# EAGLE design Arduino LocoNet Marklin i2c Expansion (EAGLE 9.6.2)
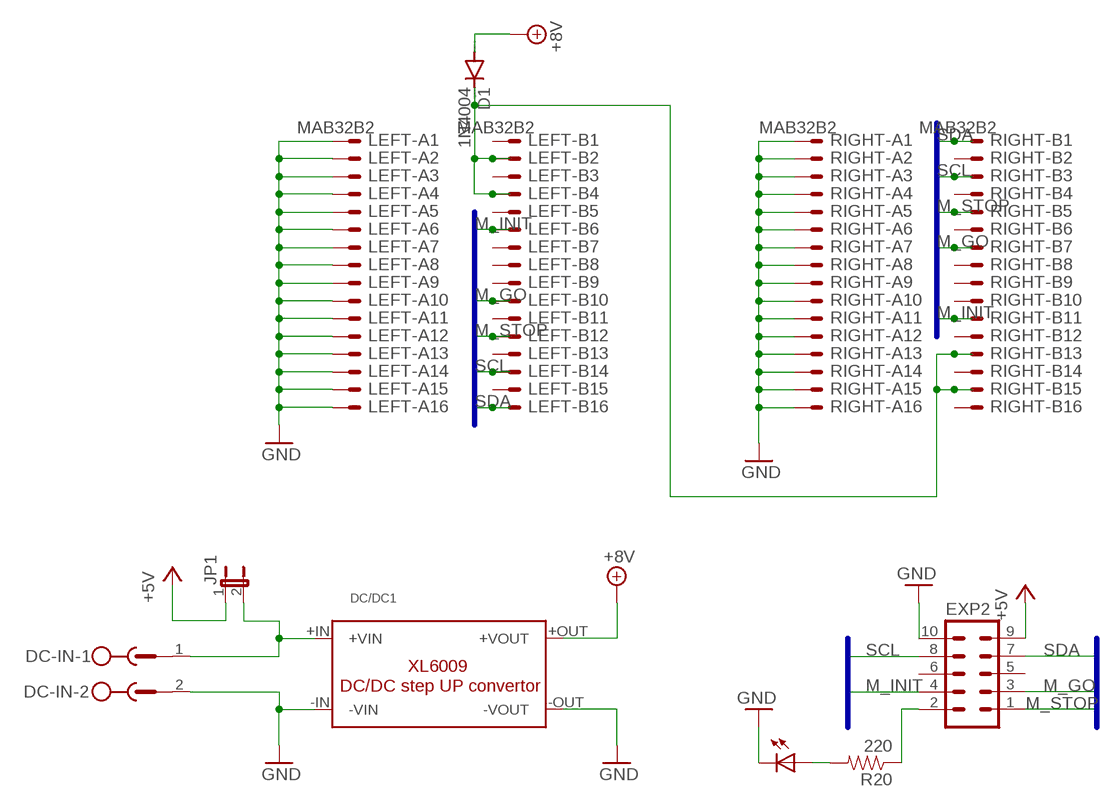
[diagram p0: schematic, sheet 1]

## Parts
D1  1N4004  [DO41-10]
DC-IN  2EDG-02  [2EDG-02]
DC/DC1  DC/DC-STEP-UP-XL6009  [DC/DC-STEP-UP-XL6009]
EXP2  ML10  [ML10]
JP1  JP1E  [JP1]
LED  RED  LED3MM  [LED3MM]
LEFT  MAB32B2  [MAB32B2]
R20  220  RESISTORAXIAL-0.3  [AXIAL-0.3]
RIGHT  MAB32B2  [MAB32B2]

## Nets
+5V [5v]: EXP2.9 JP1.1
+8V [8v]: D1.A DC/DC1.+OUT(+VOUT)
DC+ [5v]: DC-IN.1 DC/DC1.+IN(+VIN) JP1.2
GND [ground]: DC-IN.2 DC/DC1.-IN(-VIN) DC/DC1.-OUT(-VOUT) EXP2.10 LED.K(C) LEFT.A1 LEFT.A2 LEFT.A3 LEFT.A4 LEFT.A5 LEFT.A6 LEFT.A7 LEFT.A8 LEFT.A9 LEFT.A10 LEFT.A11 LEFT.A12 LEFT.A13 LEFT.A14 LEFT.A15 LEFT.A16 RIGHT.A1 RIGHT.A2 RIGHT.A3 RIGHT.A4 RIGHT.A5 RIGHT.A6 RIGHT.A7 RIGHT.A8 RIGHT.A9 RIGHT.A10 RIGHT.A11 RIGHT.A12 RIGHT.A13 RIGHT.A14 RIGHT.A15 RIGHT.A16
M_GO [Marklin]: EXP2.3 LEFT.B10 RIGHT.B7
M_INIT [Marklin]: EXP2.4 LEFT.B6 RIGHT.B11
M_STOP [Marklin]: EXP2.1 LEFT.B12 RIGHT.B5
N$3: LED.A R20.P$2
N$5 [8v]: D1.C LEFT.B2 LEFT.B4 RIGHT.B13 RIGHT.B15
PIN13: EXP2.2 R20.P$1
SCL: EXP2.8 LEFT.B14 RIGHT.B3
SDA: EXP2.7 LEFT.B16 RIGHT.B1
Unconnected: EXP2.5 EXP2.6 LEFT.B1 LEFT.B3 LEFT.B5 LEFT.B7 LEFT.B8 LEFT.B9 LEFT.B11 LEFT.B13 LEFT.B15 RIGHT.B2 RIGHT.B4 RIGHT.B6 RIGHT.B8 RIGHT.B9 RIGHT.B10 RIGHT.B12 RIGHT.B14 RIGHT.B16

## Buses
MARKLIN:M_GO,M_INIT,M_STOP,SCL,SDA

## Library data of the parts
D1 = diode:1N4004: DIODE general purpose rectifier, 1 A
DC-IN = 2EDG Connectors 5.08mm - Full Silkscreen on PCB v1-0:2EDG-02: 2EDG Connectors Rembrandt Electronics
DC/DC1 = hacesoft:DC/DC-STEP-UP-XL6009
EXP2 = con-ml:ML10: HARTING; OC_FARNELL: unknown; OC_NEWARK: unknown
JP1 = jumper:JP1E: JUMPER
LED = led:LED: LED OSRAM: - CHIPLED LG R971, LG N971, LY N971, LG Q971, LY Q971, LO R971, LY R971 LH N974, LH R974 LS Q976, LO Q976, LY Q976 LO Q996 - Hyper CHIPLED LW Q18S LB Q993, LB Q99A, LB R99A - SideLED LS A670, LO A670, LY A670, LG A670, LP A670 LB A673, LV A673, LT A673, LW A673 LH A674 LY A675 LS A676, LA A676, LO A676, LY A676, LW A676 LS A679, LY A679, LG A679 - Hyper Micro SIDELED® LS Y876, LA Y876, LO Y876, LY Y876 LT Y87S - SmartLED LW L88C, LW L88S LB L89C, LB L89S, LG L890 LS L89K, LO L89K, LY L89K LS L896, LA L896, LO L896, LY L896 - TOPLED LS T670, LO T670, LY T670, LG T670, LP T670 LSG T670, LSP T670, LSY T670, LOP T670, LYG T670 LG T671, LOG T671, LSG T671 LB T673, LV T673, LT T673, LW T673 LH T674 LS T676, LA T676, LO T676, LY T676, LB T676, LH T676, LSB T676, LW T676 LB T67C, LV T67C, LT T67C, LS T67K, LO T67K, LY T67K, LW E67C LS E67B, LA E67B, LO E67B, LY E67B, LB E67C, LV E67C, LT E67C LW T67C LS T679, LY T679, LG T679 LS T770, LO T770, LY T770, LG T770, LP T770 LB T773, LV T773, LT T773, LW T773 LH T774 LS E675, LA E675, LY E675, LS T675 LS T776, LA T776, LO T776, LY T776, LB T776 LHGB T686 LT T68C, LB T68C - Hyper Mini TOPLED® LB M676 - Mini TOPLED Santana® LG M470 LS M47K, LO M47K, LY M47K Source: http://www.osram.convergy.de LUXEON: - LUMILED® LXK2-PW12-R00, LXK2-PW12-S00, LXK2-PW14-U00, LXK2-PW14-V00 LXK2-PM12-R00, LXK2-PM12-S00, LXK2-PM14-U00 LXK2-PE12-Q00, LXK2-PE12-R00, LXK2-PE12-S00, LXK2-PE14-T00, LXK2-PE14-U00 LXK2-PB12-K00, LXK2-PB12-L00, LXK2-PB12-M00, LXK2-PB14-N00, LXK2-PB14-P00, LXK2-PB14-Q00 LXK2-PR12-L00, LXK2-PR12-M00, LXK2-PR14-Q00, LXK2-PR14-R00 LXK2-PD12-Q00, LXK2-PD12-R00, LXK2-PD12-S00 LXK2-PH12-R00, LXK2-PH12-S00 LXK2-PL12-P00, LXK2-PL12-Q00, LXK2-PL12-R00 Source: www.luxeon.com KINGBRIGHT: KA-3528ASYC Source: www.kingbright.com
LEFT RIGHT = con-vg:MAB32B2: CONNECTOR male, 32 pins, single, type B/2, rows AB, grid 2.54 mm
R20 = SparkFun-Resistors:RESISTOR: Resistor Basic schematic elements and footprints for 0603, 1206, and PTH resistors.

## Net classes
0 default: width 0.305 mm
1 ground: width 0.61 mm
2 5v: width 0.61 mm
3 8v: width 0.61 mm
4 Marklin: width 0.61 mm
5 24V: width 0.66 mm

## Board
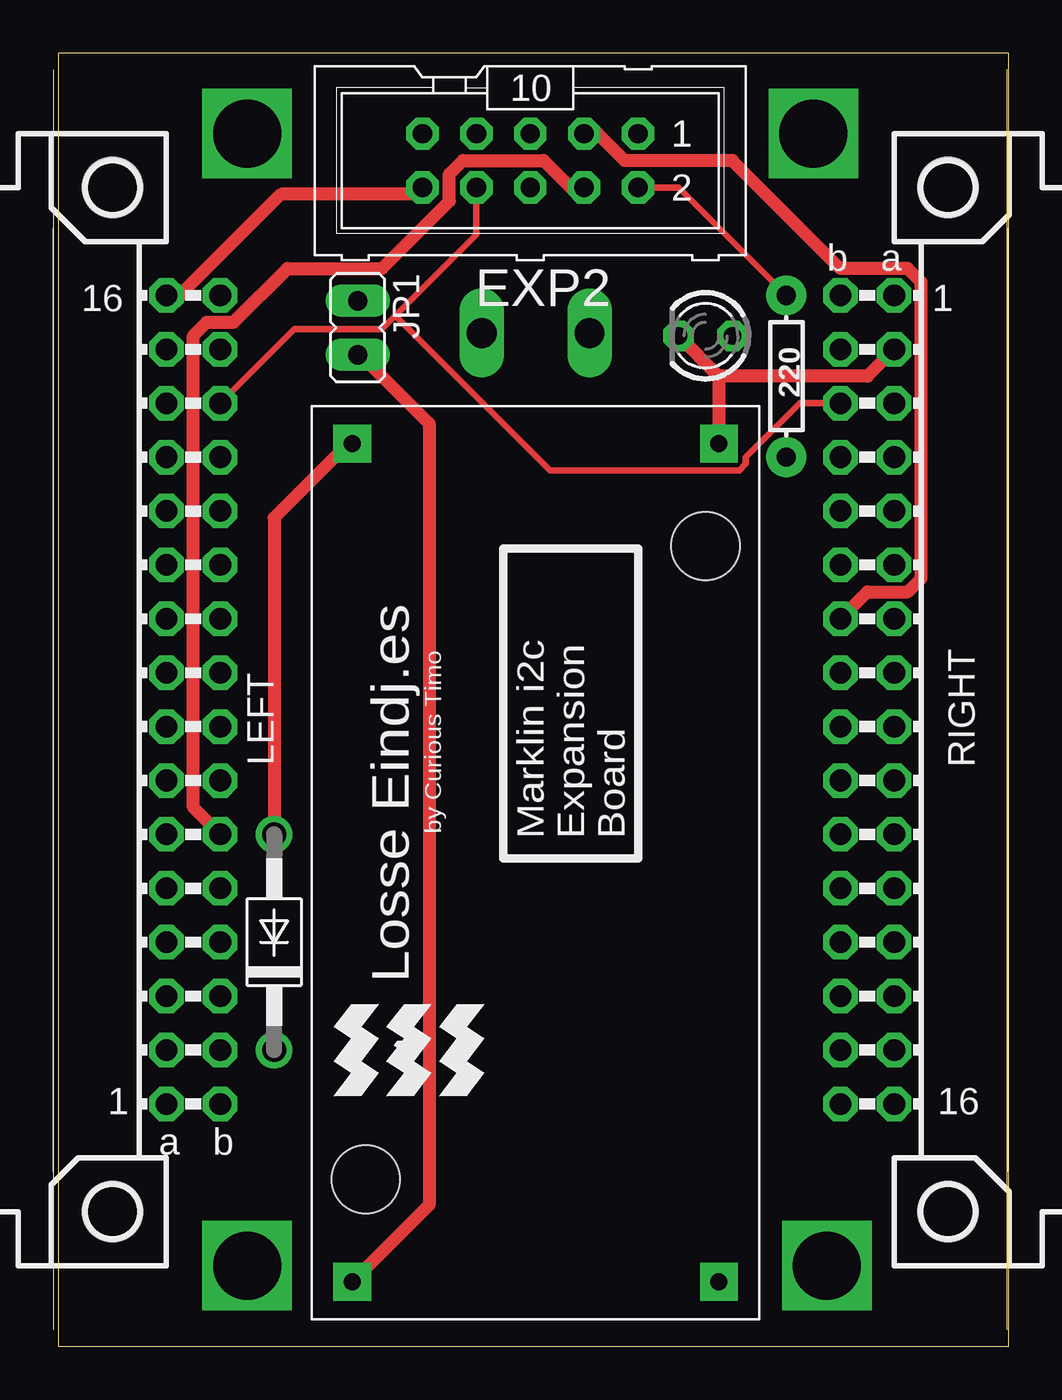
[diagram p1: board, top side]
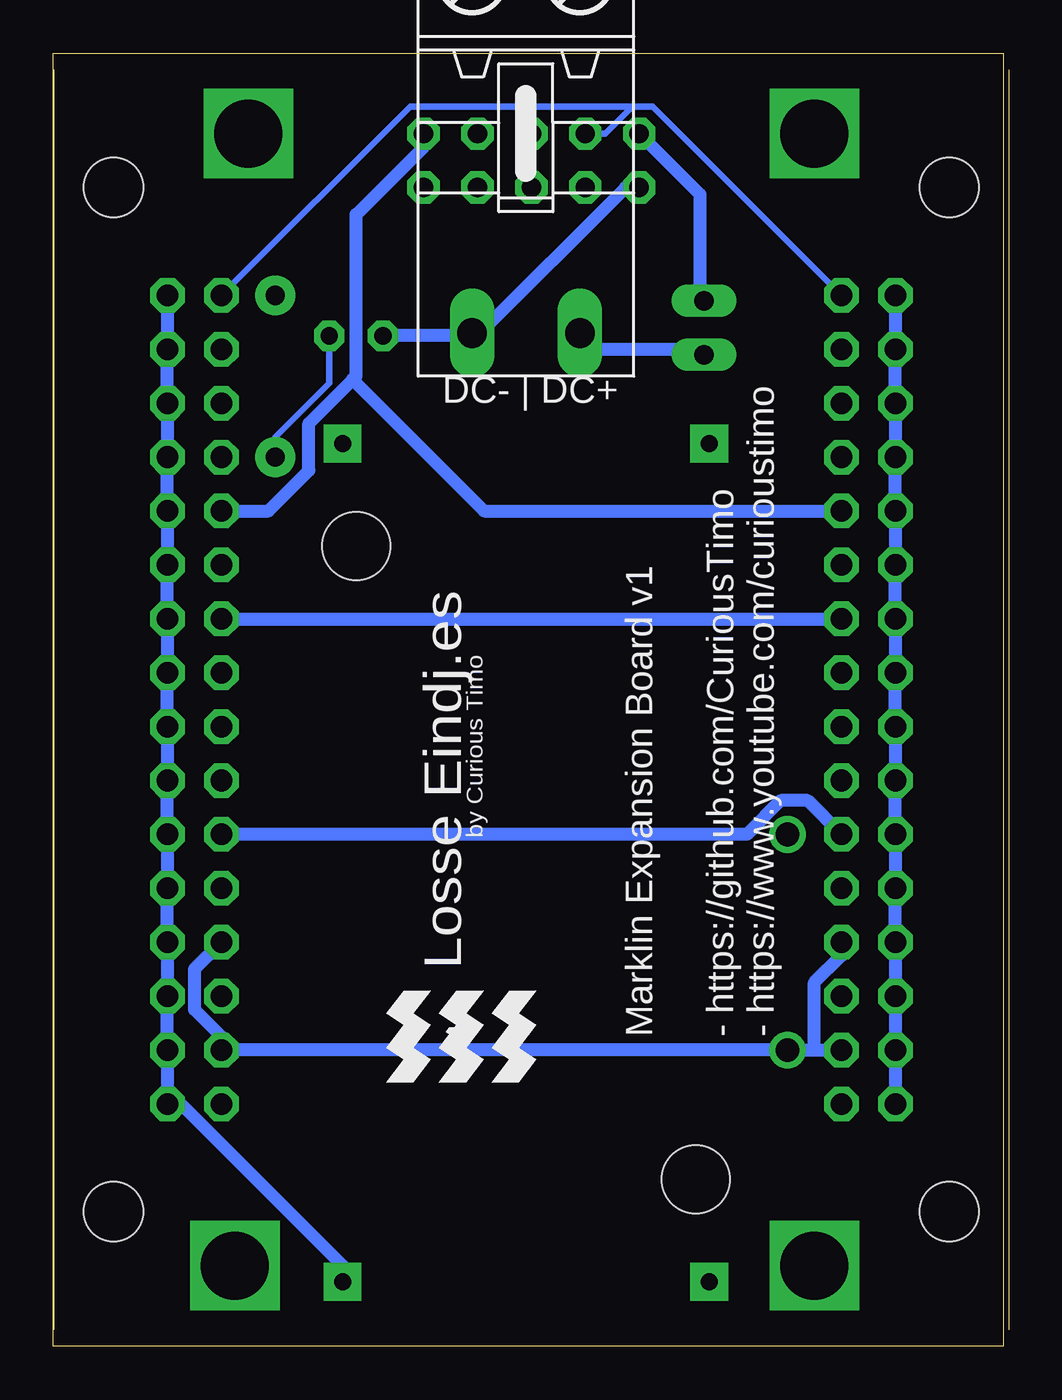
[diagram p2: board, bottom side, seen from below]

Size 44.76 x 60.95 mm. Coordinates in mm from the lower left corner, seen from the top.
Outline: 0,0 44.76,0 44.76,60.95 0,60.95 0,0
Copper layers (1*16): Top 0.035mm / dielectric 1.5mm / Bottom 0.035mm
Design rules "default *": minimum track width 6mil, minimum drill 0.35mm, track to track 6mil, track to pad 6mil, pad to pad 6mil, via to via 6mil, smd to smd 6mil, copper to edge 40mil, drill to drill 6mil, minimum pad ring 12mil, minimum via ring 8mil, stop-mask expansion 4mil, vias tented up to drill 0mil, thermal gap 10mil

### Footprints (pad centres in the part's own frame; a part is rotated, then mirrored left to right if it is on the bottom)
DO41-10 = drill 1.118: A 5.08,0; C -5.08,0
2EDG-02 = drill 1.397 long: 1 -2.54,7.62; 2 2.54,7.62
DC/DC-STEP-UP-XL6009 = drill 0.8 pad 1.778 square: +IN 1.778,19.177; +OUT 41.275,19.177; -IN 1.778,1.905; -OUT 41.275,1.905 | hole 3.2: 6.604,18.542; 36.449,2.54
ML10 = drill 0.914 octagon: 1 -5.08,-1.27; 2 -5.08,1.27; 3 -2.54,-1.27; 4 -2.54,1.27; 5 0,-1.27; 6 0,1.27; 7 2.54,-1.27; 8 2.54,1.27; 9 5.08,-1.27; 10 5.08,1.27
JP1 = drill 0.914 long: 1 0,-1.27; 2 0,1.27
LED3MM = drill 0.813 octagon: A -1.27,0; K 1.27,0
MAB32B2 = drill 1.016 octagon: A1 -2.54,19.05; A2 -2.54,16.51; A3 -2.54,13.97; A4 -2.54,11.43; A5 -2.54,8.89; A6 -2.54,6.35; A7 -2.54,3.81; A8 -2.54,1.27; A9 -2.54,-1.27; A10 -2.54,-3.81; A11 -2.54,-6.35; A12 -2.54,-8.89; A13 -2.54,-11.43; A14 -2.54,-13.97; A15 -2.54,-16.51; A16 -2.54,-19.05; B1 -5.08,19.05; B2 -5.08,16.51; B3 -5.08,13.97; B4 -5.08,11.43; B5 -5.08,8.89; B6 -5.08,6.35; B7 -5.08,3.81; B8 -5.08,1.27; B9 -5.08,-1.27; B10 -5.08,-3.81; B11 -5.08,-6.35; B12 -5.08,-8.89; B13 -5.08,-11.43; B14 -5.08,-13.97; B15 -5.08,-16.51; B16 -5.08,-19.05 | hole 2.794: 0,24.13; 0,-24.13
AXIAL-0.3 = drill 0.9 pad 1.88: P$1 -3.81,0; P$2 3.81,0

### Placement (x,y rotation side)
D1  10.16,19.05 90 top
DC-IN  22.48,55.37 180 bottom
DC/DC1  33.02,1.27 90 top
EXP2  22.23,55.88 180 top
JP1  14.1,48.01 180 top
LED  30.48,47.62 180 top
LEFT  2.54,30.48 180 top
R20  34.29,45.72 270 top
RIGHT  41.91,30.48 0 top

### Tracks (layer width: path | path; a pad name or v marks a point on that pad's centre or on a via)
+5V
  Bottom 0.61: EXP2.9 14.29,54.29 14.29,49.53 JP1.1
+8V
  Top 0.61: D1.A 10.16,39.05 13.65,42.55 DC/DC1.+OUT
DC+
  Top 0.61: DC/DC1.+IN 17.46,6.67 17.46,43.5 14.29,46.67 JP1.2
  Bottom 0.61: JP1.2 14.29,46.99 19.05,46.99 19.68,47.62 DC-IN.1
GND
  Top 0.61: 31.11,45.72 DC/DC1.-OUT | LED.K 31.11,45.72 | 31.11,45.72 38.1,45.72 RIGHT.A2 | LEFT.A16 5.71,49.53 10.48,54.29 16.83,54.29 EXP2.10
  Bottom 0.61: LEFT.A16 LEFT.A15 LEFT.A14 LEFT.A13 LEFT.A12 LEFT.A11 LEFT.A10 LEFT.A9 LEFT.A8 LEFT.A7 LEFT.A6 LEFT.A5 LEFT.A4 LEFT.A3 LEFT.A2 LEFT.A1 | LED.K 25.08,47.62 DC-IN.2 24.77,47.62 17.78,54.61 EXP2.10 | RIGHT.A1 RIGHT.A2 RIGHT.A3 RIGHT.A4 RIGHT.A5 RIGHT.A6 RIGHT.A7 RIGHT.A8 RIGHT.A9 RIGHT.A10 RIGHT.A11 RIGHT.A12 RIGHT.A13 RIGHT.A14 RIGHT.A15 39.37,12.06 | DC/DC1.-IN 31.11,3.81 39.37,12.06 | 39.37,12.06 RIGHT.A16
M_GO
  Top 0.61: EXP2.3 25.4,57.15 26.67,55.88 31.75,55.88 36.83,50.8 40.01,50.8 40.64,50.16 40.64,36.2 40.01,35.56 38.1,35.56 RIGHT.B7
  Bottom 0.61: RIGHT.B7 LEFT.B10
M_INIT
  Top 0.61: EXP2.4 24.13,54.61 22.86,55.88 19.05,55.88 18.41,55.24 18.41,53.98 15.24,50.8 10.79,50.8 8.26,48.26 6.99,48.26 6.35,47.62 6.35,25.4 LEFT.B6
  Bottom 0.61: RIGHT.B11 12.06,24.13 10.48,25.72 9.21,25.72 LEFT.B6
M_STOP
  Bottom 0.61: EXP2.1 27.3,56.52 30.48,53.34 30.48,45.72 30.64,45.56 | 30.64,45.56 32.7,43.5 32.7,41.27 34.61,39.37 RIGHT.B5 | LEFT.B12 24.45,39.37 30.64,45.56
N$1  (via drill 3.2 pad 3.81)
  other vias: 35.56,57.15
N$2  (via drill 3.2 pad 3.81)
  other vias: 36.2,3.81
N$3
  Bottom 0.305: LED.A 31.75,45.4 34.29,42.86 R20.P$2
N$4  (via drill 3.2 pad 3.81)
  other vias: 8.89,3.81
N$5
  Bottom 0.61: RIGHT.B13 38.1,17.78 38.1,15.88 36.83,14.61 RIGHT.B15 D1.C 8.89,13.97 | 8.89,13.97 LEFT.B2 | LEFT.B4 7.62,18.41 8.89,17.14 8.89,13.97
N$6  (via drill 3.2 pad 3.81)
  other vias: 8.89,57.15
PIN13
  Top 0.305: EXP2.2 29.21,54.61 R20.P$1
SCL
  Top 0.305: EXP2.8 19.68,52.39 15.88,48.58 | 15.88,48.58 15.24,47.94 11.11,47.94 LEFT.B14 | RIGHT.B3 34.92,44.45 32.38,41.91 32.38,41.59 32.07,41.27 23.18,41.27 15.88,48.58
SDA
  Bottom 0.305: EXP2.7 18.73,57.15 17.46,58.42 | 17.46,58.42 16.51,58.42 LEFT.B16 | RIGHT.B1 27.94,58.42 17.46,58.42

### Text on the board
bPlace: by Curious Timo | Losse Eindj.es | Marklin Expansion Board v1 / / - https://github.com/CuriousTimo / - https://www.youtube.com/curioustimo
tNames: by Curious Timo | Marklin i2c / Expansion / Board | Losse Eindj.es
bNames: DC- | DC+